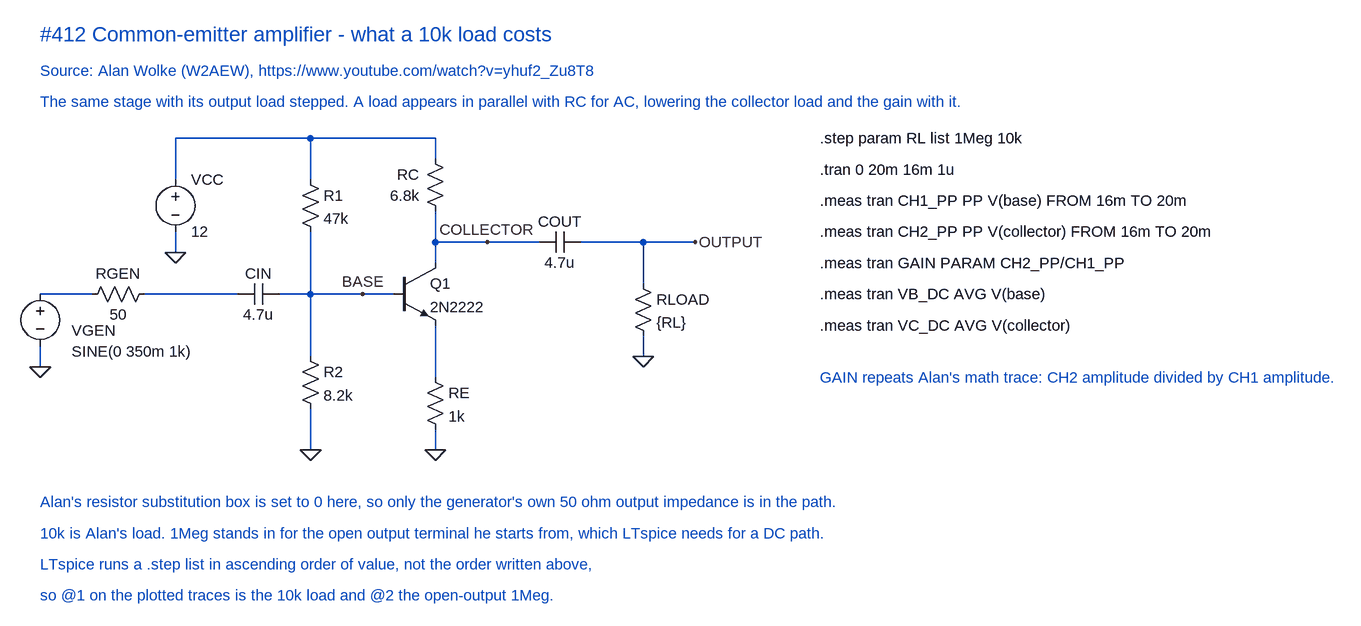
[diagram p0: schematic Collector load comparison.asc]
Collector load comparison.asc, the LTspice schematic file:
Version 4.1
SHEET 1 1600 1100
WIRE -256 112 -176 112
WIRE -96 112 48 112
WIRE 112 112 160 112
WIRE -256 192 -256 224
WIRE -48 -128 -48 -64
WIRE 160 -128 -48 -128
WIRE 352 -128 160 -128
WIRE 352 -96 352 -128
WIRE 160 -64 160 -128
WIRE -48 48 -48 16
WIRE 352 32 352 -16
WIRE 512 32 352 32
WIRE 352 64 352 32
WIRE 672 32 576 32
WIRE 752 32 672 32
WIRE 672 96 672 32
WIRE 160 112 160 16
WIRE 240 112 160 112
WIRE 288 112 240 112
WIRE 160 208 160 112
WIRE 352 240 352 160
WIRE 672 208 672 176
WIRE 160 352 160 288
WIRE 352 352 352 320
FLAG -256 224 0
FLAG -48 48 0
FLAG 160 352 0
FLAG 352 352 0
FLAG 672 208 0
FLAG 240 112 BASE
FLAG 432 32 COLLECTOR
FLAG 752 32 OUTPUT
SYMBOL voltage -256 96 R0
WINDOW 0 48 72 Left 2
WINDOW 3 48 104 Left 2
SYMATTR InstName VGEN
SYMATTR Value SINE(0 350m 1k)
SYMBOL res -80 96 R90
WINDOW 0 0 56 VBottom 2
WINDOW 3 32 56 VTop 2
SYMATTR InstName RGEN
SYMATTR Value 50
SYMBOL cap 112 96 R90
WINDOW 0 0 32 VBottom 2
WINDOW 3 32 32 VTop 2
SYMATTR InstName CIN
SYMATTR Value 4.7u
SYMBOL voltage -48 -80 R0
SYMATTR InstName VCC
SYMATTR Value 12
SYMBOL res 144 -80 R0
SYMATTR InstName R1
SYMATTR Value 47k
SYMBOL res 144 192 R0
SYMATTR InstName R2
SYMATTR Value 8.2k
SYMBOL res 336 -112 R0
WINDOW 0 -8 40 Right 2
WINDOW 3 -8 72 Right 2
SYMATTR InstName RC
SYMATTR Value 6.8k
SYMBOL npn 288 64 R0
SYMATTR InstName Q1
SYMATTR Value 2N2222
SYMBOL res 336 224 R0
SYMATTR InstName RE
SYMATTR Value 1k
SYMBOL cap 576 16 R90
WINDOW 0 0 32 VBottom 2
WINDOW 3 32 32 VTop 2
SYMATTR InstName COUT
SYMATTR Value 4.7u
SYMBOL res 656 80 R0
SYMATTR InstName RLOAD
SYMATTR Value {RL}
TEXT -256 -288 Left 3 ;#412 Common-emitter amplifier - what a 10k load costs
TEXT -256 -232 Left 2 ;Source: Alan Wolke (W2AEW), https://www.youtube.com/watch?v=yhuf2_Zu8T8
TEXT -256 -184 Left 2 ;The same stage with its output load stepped. A load appears in parallel with RC for AC, lowering the collector load and the gain with it.
TEXT 944 -128 Left 2 !.step param RL list 1Meg 10k
TEXT 944 -80 Left 2 !.tran 0 20m 16m 1u
TEXT 944 -32 Left 2 !.meas tran CH1_PP PP V(base) FROM 16m TO 20m
TEXT 944 16 Left 2 !.meas tran CH2_PP PP V(collector) FROM 16m TO 20m
TEXT 944 64 Left 2 !.meas tran GAIN PARAM CH2_PP/CH1_PP
TEXT 944 112 Left 2 !.meas tran VB_DC AVG V(base)
TEXT 944 160 Left 2 !.meas tran VC_DC AVG V(collector)
TEXT 944 240 Left 2 ;GAIN repeats Alan's math trace: CH2 amplitude divided by CH1 amplitude.
TEXT -256 432 Left 2 ;Alan's resistor substitution box is set to 0 here, so only the generator's own 50 ohm output impedance is in the path.
TEXT -256 480 Left 2 ;10k is Alan's load. 1Meg stands in for the open output terminal he starts from, which LTspice needs for a DC path.
TEXT -256 528 Left 2 ;LTspice runs a .step list in ascending order of value, not the order written above,
TEXT -256 576 Left 2 ;so @1 on the plotted traces is the 10k load and @2 the open-output 1Meg.

The netlist it stands for:
* Collector load comparison.asc
VGEN N001 0 SINE(0 350m 1k)
RGEN N002 N001 50
CIN BASE N002 4.7u
VCC N003 0 12
R1 N003 BASE 47k
R2 BASE 0 8.2k
RC N003 COLLECTOR 6.8k
Q1 COLLECTOR BASE N004 0 2N2222
RE N004 0 1k
COUT OUTPUT COLLECTOR 4.7u
RLOAD OUTPUT 0 {RL}
.model NPN NPN
.model PNP PNP
.lib standard.bjt
* #412 Common-emitter amplifier - what a 10k load costs
* Source: Alan Wolke (W2AEW), https://www.youtube.com/watch?v=yhuf2_Zu8T8
* The same stage with its output load stepped. A load appears in parallel with RC for AC, lowering the collector load and the gain with it.
.step param RL list 1Meg 10k
.tran 0 20m 16m 1u
.meas tran CH1_PP PP V(base) FROM 16m TO 20m
.meas tran CH2_PP PP V(collector) FROM 16m TO 20m
.meas tran GAIN PARAM CH2_PP/CH1_PP
.meas tran VB_DC AVG V(base)
.meas tran VC_DC AVG V(collector)
* GAIN repeats Alan's math trace: CH2 amplitude divided by CH1 amplitude.
* Alan's resistor substitution box is set to 0 here, so only the generator's own 50 ohm output impedance is in the path.
* 10k is Alan's load. 1Meg stands in for the open output terminal he starts from, which LTspice needs for a DC path.
* LTspice runs a .step list in ascending order of value, not the order written above,
* so @1 on the plotted traces is the 10k load and @2 the open-output 1Meg.
.backanno
.end